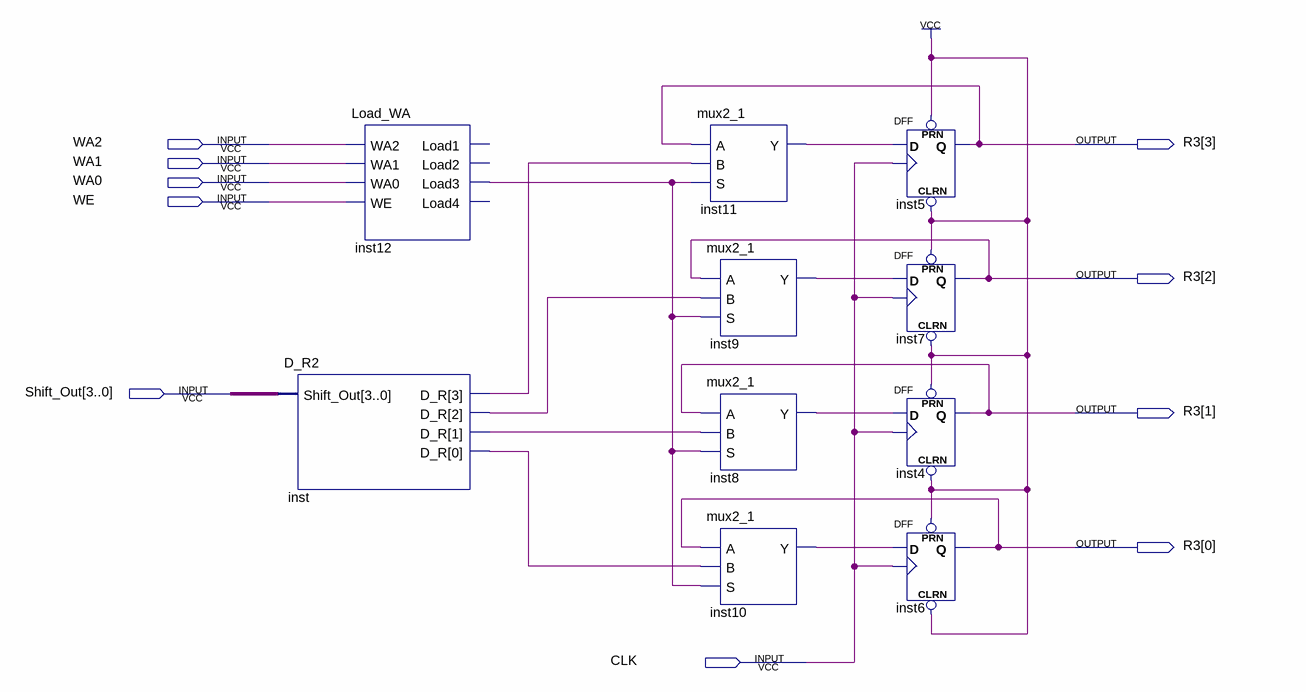
[diagram p0: schematic sheet]
// Quartus schematic R3_4bit.bdf as structural Verilog: 10 symbols, 10 pins
module R3_4bit (
  input  WA2,
  input  WA1,
  input  WA0,
  input  WE,
  input  [3:0] Shift_Out,
  input  CLK,
  output [3:0] R3
);

  wire inst8_y, inst9_y, inst10_y, inst11_y, inst12_load3, inst_d_r, inst_d_r_2, inst_d_r_3, inst_d_r_4;

  D_R2 inst (.Shift_Out(Shift_Out), .D_R({inst_d_r, inst_d_r_2, inst_d_r_3, inst_d_r_4}));
  Load_WA inst12 (.WA2(WA2), .WA1(WA1), .WA0(WA0), .WE(WE), .Load3(inst12_load3));  // open: Load1, Load2, Load4
  mux2_1 inst11 (.A(R3[3]), .B(inst_d_r), .S(inst12_load3), .Y(inst11_y));
  mux2_1 inst9 (.A(R3[2]), .B(inst_d_r_2), .S(inst12_load3), .Y(inst9_y));
  mux2_1 inst8 (.A(R3[1]), .B(inst_d_r_3), .S(inst12_load3), .Y(inst8_y));
  mux2_1 inst10 (.A(R3[0]), .B(inst_d_r_4), .S(inst12_load3), .Y(inst10_y));
  DFF inst5 (.CLRN(1'b1), .CLK(CLK), .D(inst11_y), .PRN(1'b1), .Q(R3[3]));
  DFF inst7 (.CLRN(1'b1), .CLK(CLK), .D(inst9_y), .PRN(1'b1), .Q(R3[2]));
  DFF inst4 (.CLRN(1'b1), .CLK(CLK), .D(inst8_y), .PRN(1'b1), .Q(R3[1]));
  DFF inst6 (.CLRN(1'b1), .CLK(CLK), .D(inst10_y), .PRN(1'b1), .Q(R3[0]));
endmodule
